# Altium schematic sheet Power_Delivery_Network.SchDoc
size Letter; SheetNumber: 2; SheetTotal: 2
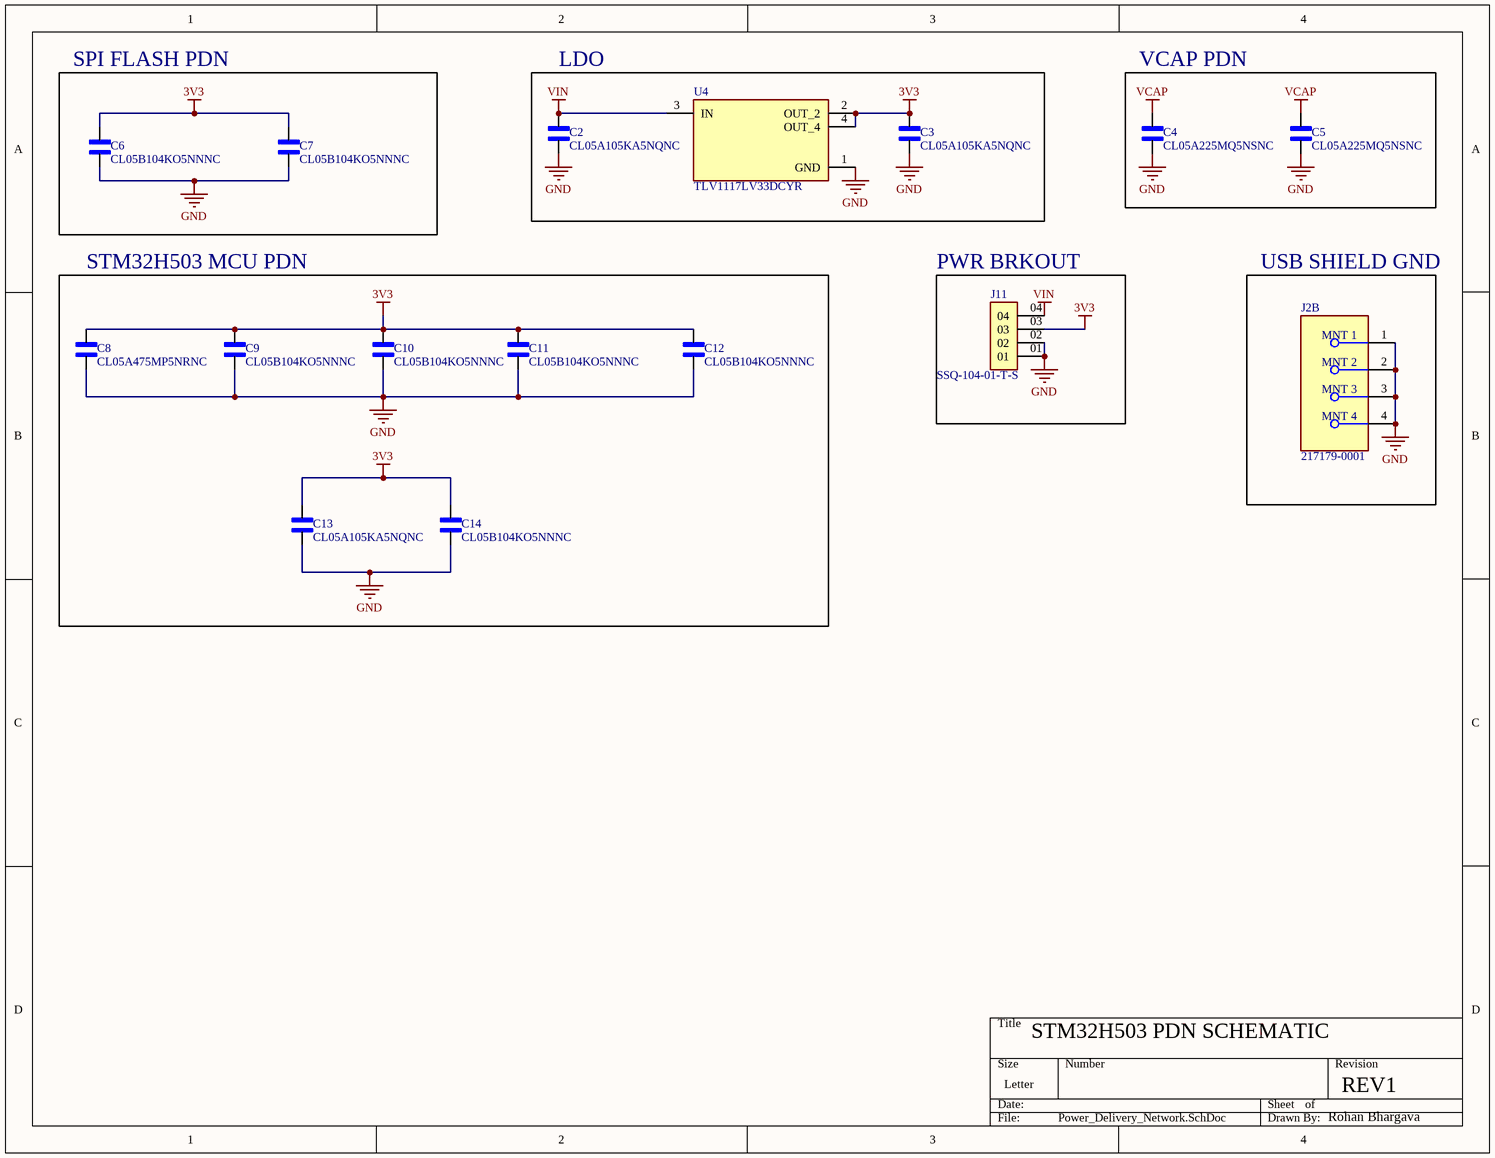
[diagram p0: Power_Delivery_Network.SchDoc]

## Parts
C2  CL05A105KA5NQNC  [CAPC1005X60N]
C3  CL05A105KA5NQNC  [CAPC1005X60N]
C4  CL05A225MQ5NSNC  [CAPC1005X57N]
C5  CL05A225MQ5NSNC  [CAPC1005X57N]
C6  CL05B104KO5NNNC  [CAPC1005X55N]
C7  CL05B104KO5NNNC  [CAPC1005X55N]
C8  CL05A475MP5NRNC  [CAPC1005X65N]
C9  CL05B104KO5NNNC  [CAPC1005X55N]
C10  CL05B104KO5NNNC  [CAPC1005X55N]
C11  CL05B104KO5NNNC  [CAPC1005X55N]
C12  CL05B104KO5NNNC  [CAPC1005X55N]
C13  CL05A105KA5NQNC  [CAPC1005X60N]
C14  CL05B104KO5NNNC  [CAPC1005X55N]
J2  217179-0001  [FP-2171790001-MFG]  (part B of 2)
J11  SSQ-104-01-T-S  [SAMTEC_SSQ-104-01-T-S]
U4  TLV1117LV33DCYR  [VREG_TLV1117LV33DCYR]

## Blocks framed on the sheet
SPI FLASH PDN: C6 C7
LDO: C2 C3 U4
VCAP PDN: C4 C5
STM32H503 MCU PDN: C8-C14
PWR BRKOUT: J11
USB SHIELD GND: J2

## Nets
3V3: C3.2 C6.2 C7.2 C8.2 C9.2 C10.2 C11.2 C12.2 C13.2 C14.2 J11.03 U4.2(OUT_2) U4.4(OUT_4)
GND: C2.1 C3.1 C4.1 C5.1 C6.1 C7.1 C8.1 C9.1 C10.1 C11.1 C12.1 C13.1 C14.1 J2.1(MNT_1) J2.2(MNT_2) J2.3(MNT_3) J2.4(MNT_4) J11.01 J11.02 U4.1(GND)
VCAP: C4.2 C5.2
VIN: C2.2 J11.04 U4.3(IN)

## Notes on the sheet
- STM32H503 PDN SCHEMATIC
- REV1
- Rohan Bhargava

## Library data of the parts
C2 C3 C13 = CL05A105KA5NQNC: 1 ÂµF Â±10% 25V Ceramic Capacitor X5R 0402 (1005 Metric); MF: Samsung; SnapEDA_Link: https://www.snapeda.com/parts/CL05A105KA5NQNC/Samsung/view-part/?ref=snap; Package: SMD-2 Samsung; Value: *; MP: CL05A105KA5NQNC; Check_prices: https://www.snapeda.com/parts/CL05A105KA5NQNC/Samsung/view-part/?ref=eda
C4 C5 = CL05A225MQ5NSNC: 2.2 ÂµF Â±20% 6.3V Ceramic Capacitor X5R 0402 (1005 Metric); MF: Samsung; SnapEDA_Link: https://www.snapeda.com/parts/CL05A225MQ5NSNC/Samsung/view-part/?ref=snap; Package: SMD-2 Samsung; Value: *; MP: CL05A225MQ5NSNC; Check_prices: https://www.snapeda.com/parts/CL05A225MQ5NSNC/Samsung/view-part/?ref=eda
C6 C7 C9-C12 C14 = CL05B104KO5NNNC: 0.1 ÂµF Â±10% 16V Ceramic Capacitor X7R 0402 (1005 Metric); MF: Samsung; SnapEDA_Link: https://www.snapeda.com/parts/CL05B104KO5NNNC/Samsung/view-part/?ref=snap; Package: SMD-2 Samsung; Value: *; MP: CL05B104KO5NNNC; Check_prices: https://www.snapeda.com/parts/CL05B104KO5NNNC/Samsung/view-part/?ref=eda
C8 = CL05A475MP5NRNC: 4.7 ÂµF Â±20% 10V Ceramic Capacitor X5R 0402 (1005 Metric); MF: Samsung; SnapEDA_Link: https://www.snapeda.com/parts/CL05A475MP5NRNC/Samsung/view-part/?ref=snap; Package: SMD-2 Samsung; Value: *; MP: CL05A475MP5NRNC; Check_prices: https://www.snapeda.com/parts/CL05A475MP5NRNC/Samsung/view-part/?ref=eda
J2 = CMP-04767-000028-2: CONN RCP USB2.0 TYP C 24P SMD RA; NexarPartId: 117190526; Gender: Receptacle; Number of Contacts: 16; Current Rating: 1.25A; Voltage Rating: 30V; Min Operating Temperature: -40°C; USB Standard: USB 2.0; Height: 3.36mm; Contact Material: Gold, Nickel; Max Operating Temperature: 85°C
J11 = SSQ-104-01-T-S: MF: Samtec Inc.; Availability: Unavailable; Value: *; Package: None; Price: None; MP: SSQ-104-01-T-S
U4 = TLV1117LV33DCYR: 1-A, low-dropout voltage regulator; MF: Texas Instruments; SnapEDA_Link: https://www.snapeda.com/parts/TLV1117LV33DCYR/Texas+Instruments/view-part/?ref=snap; Package: SOT-223-4 Texas Instruments; Value: *; MP: TLV1117LV33DCYR; Check_prices: https://www.snapeda.com/parts/TLV1117LV33DCYR/Texas+Instruments/view-part/?ref=eda